# EasyEDA Pro project fei1554973967-sw3538-dff8db20.epro, board 底板_1
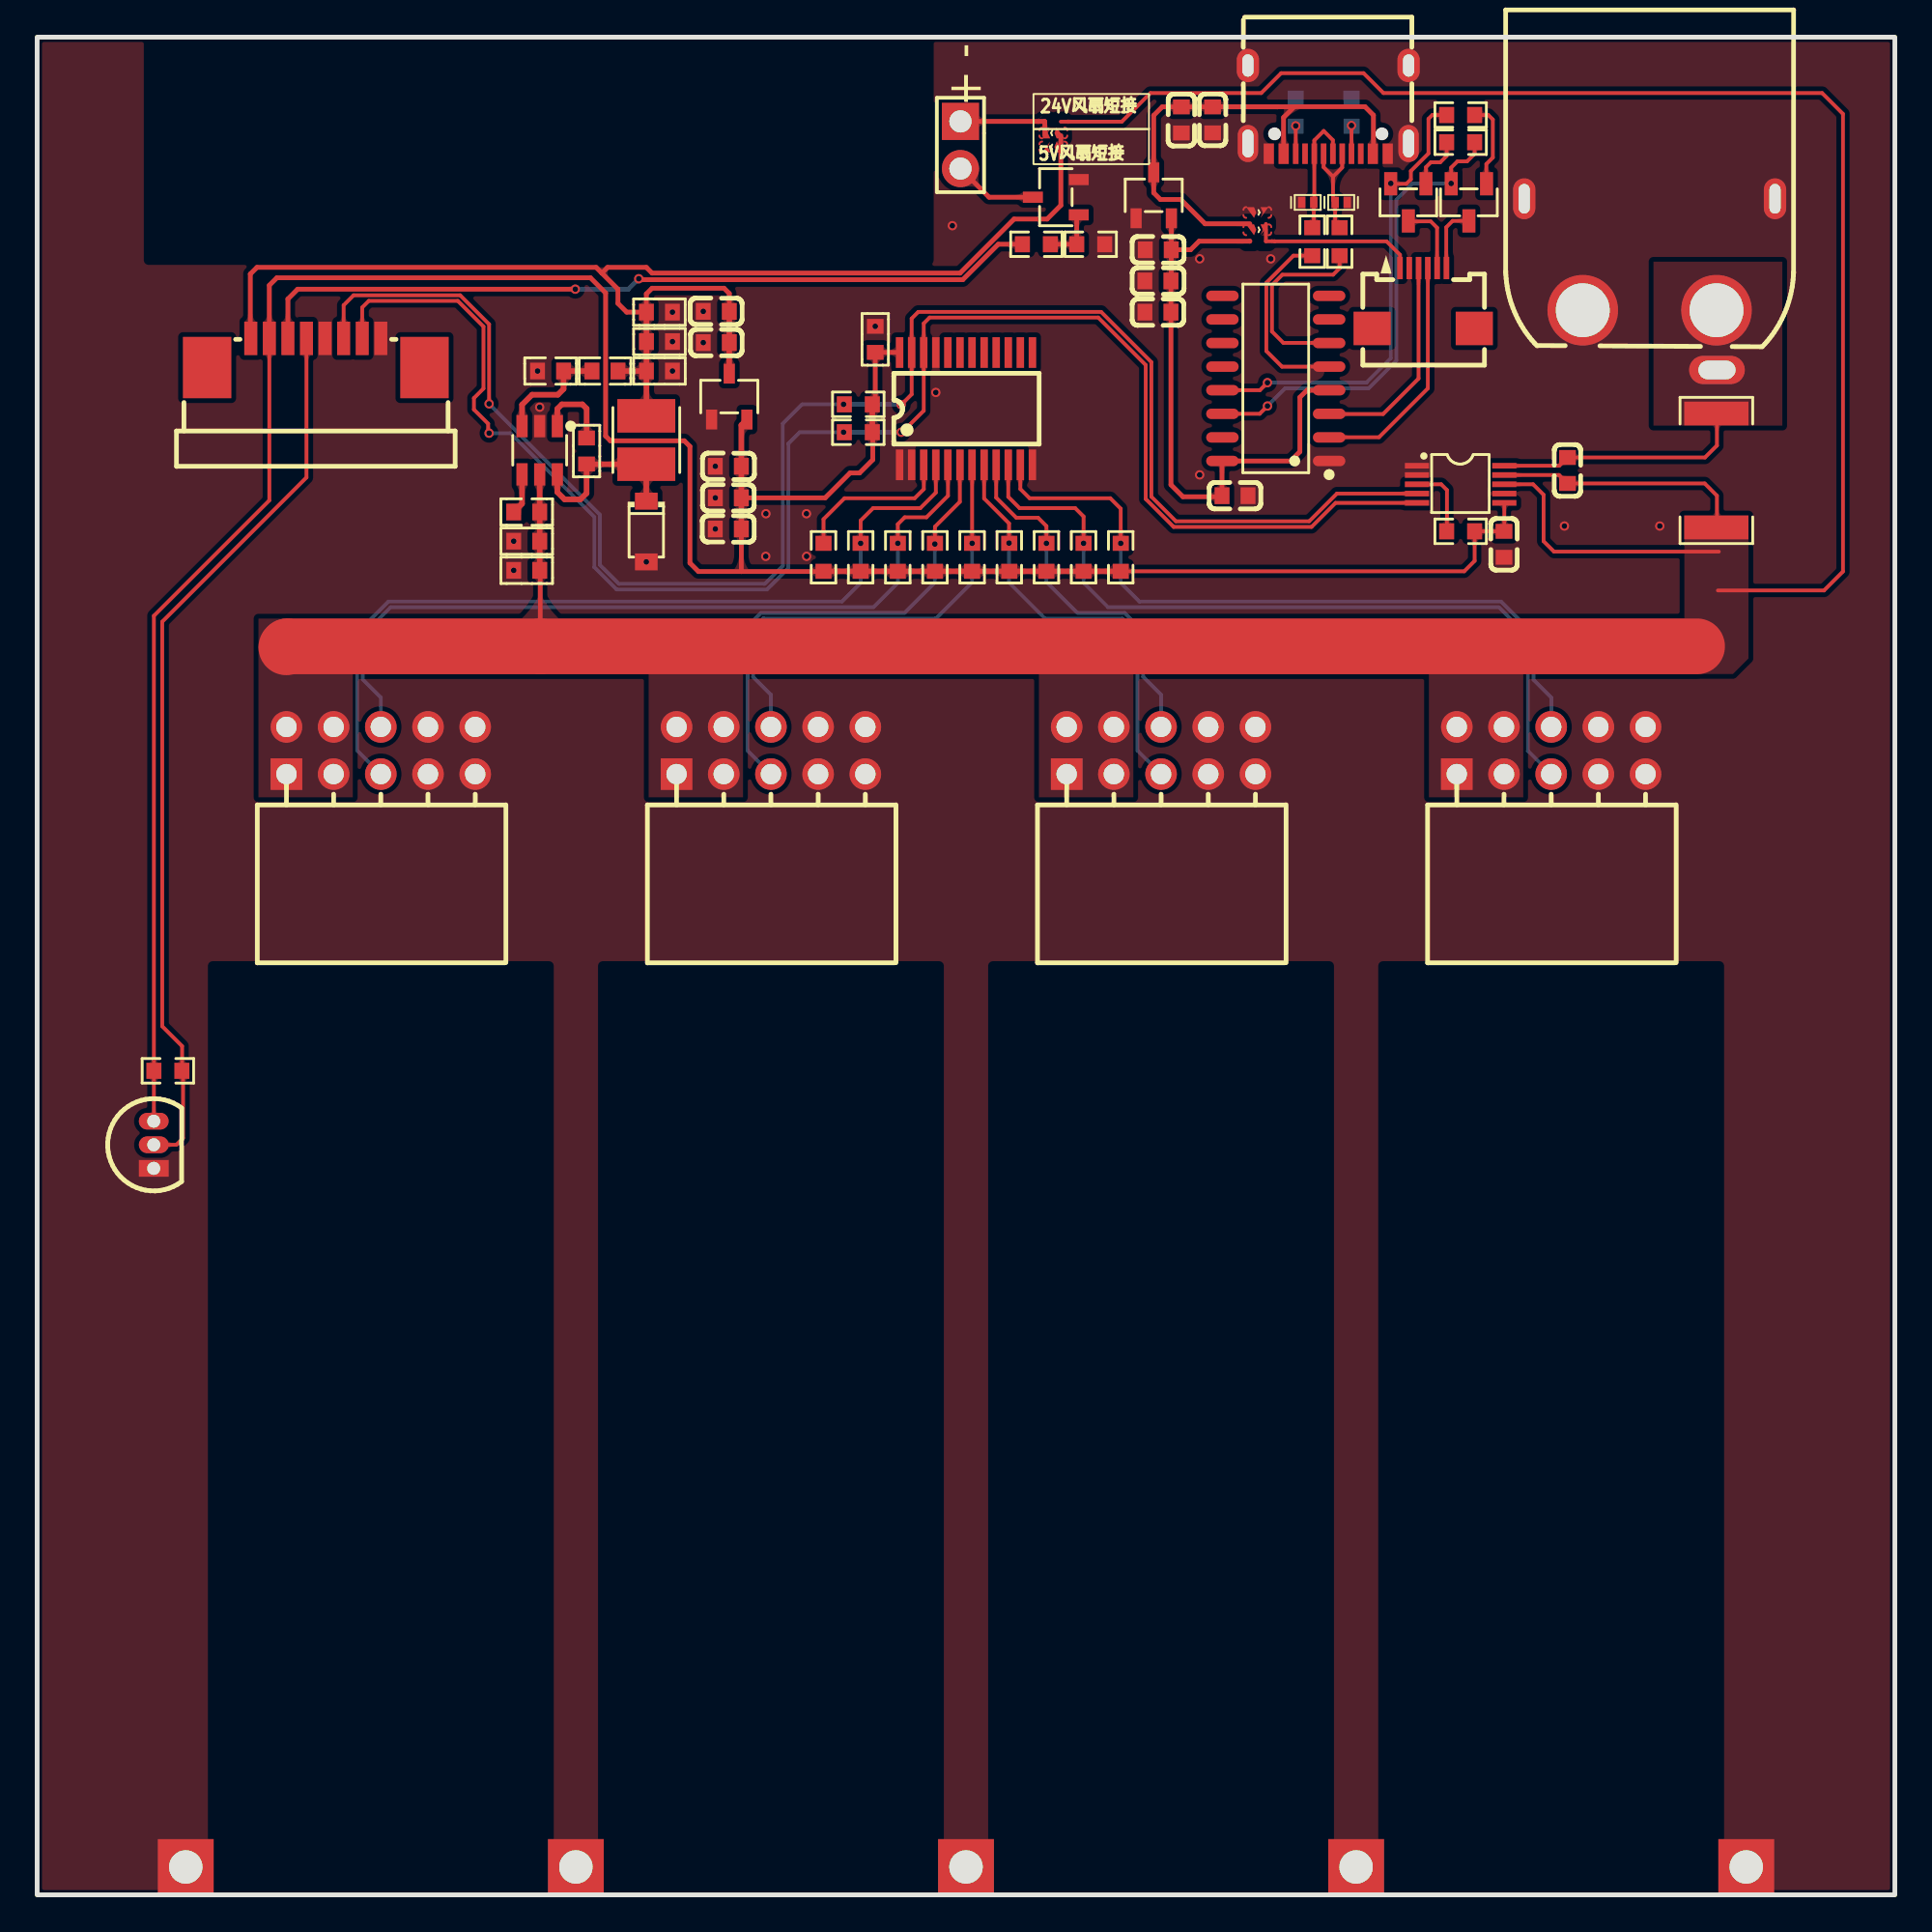
[diagram p11: board, top side]
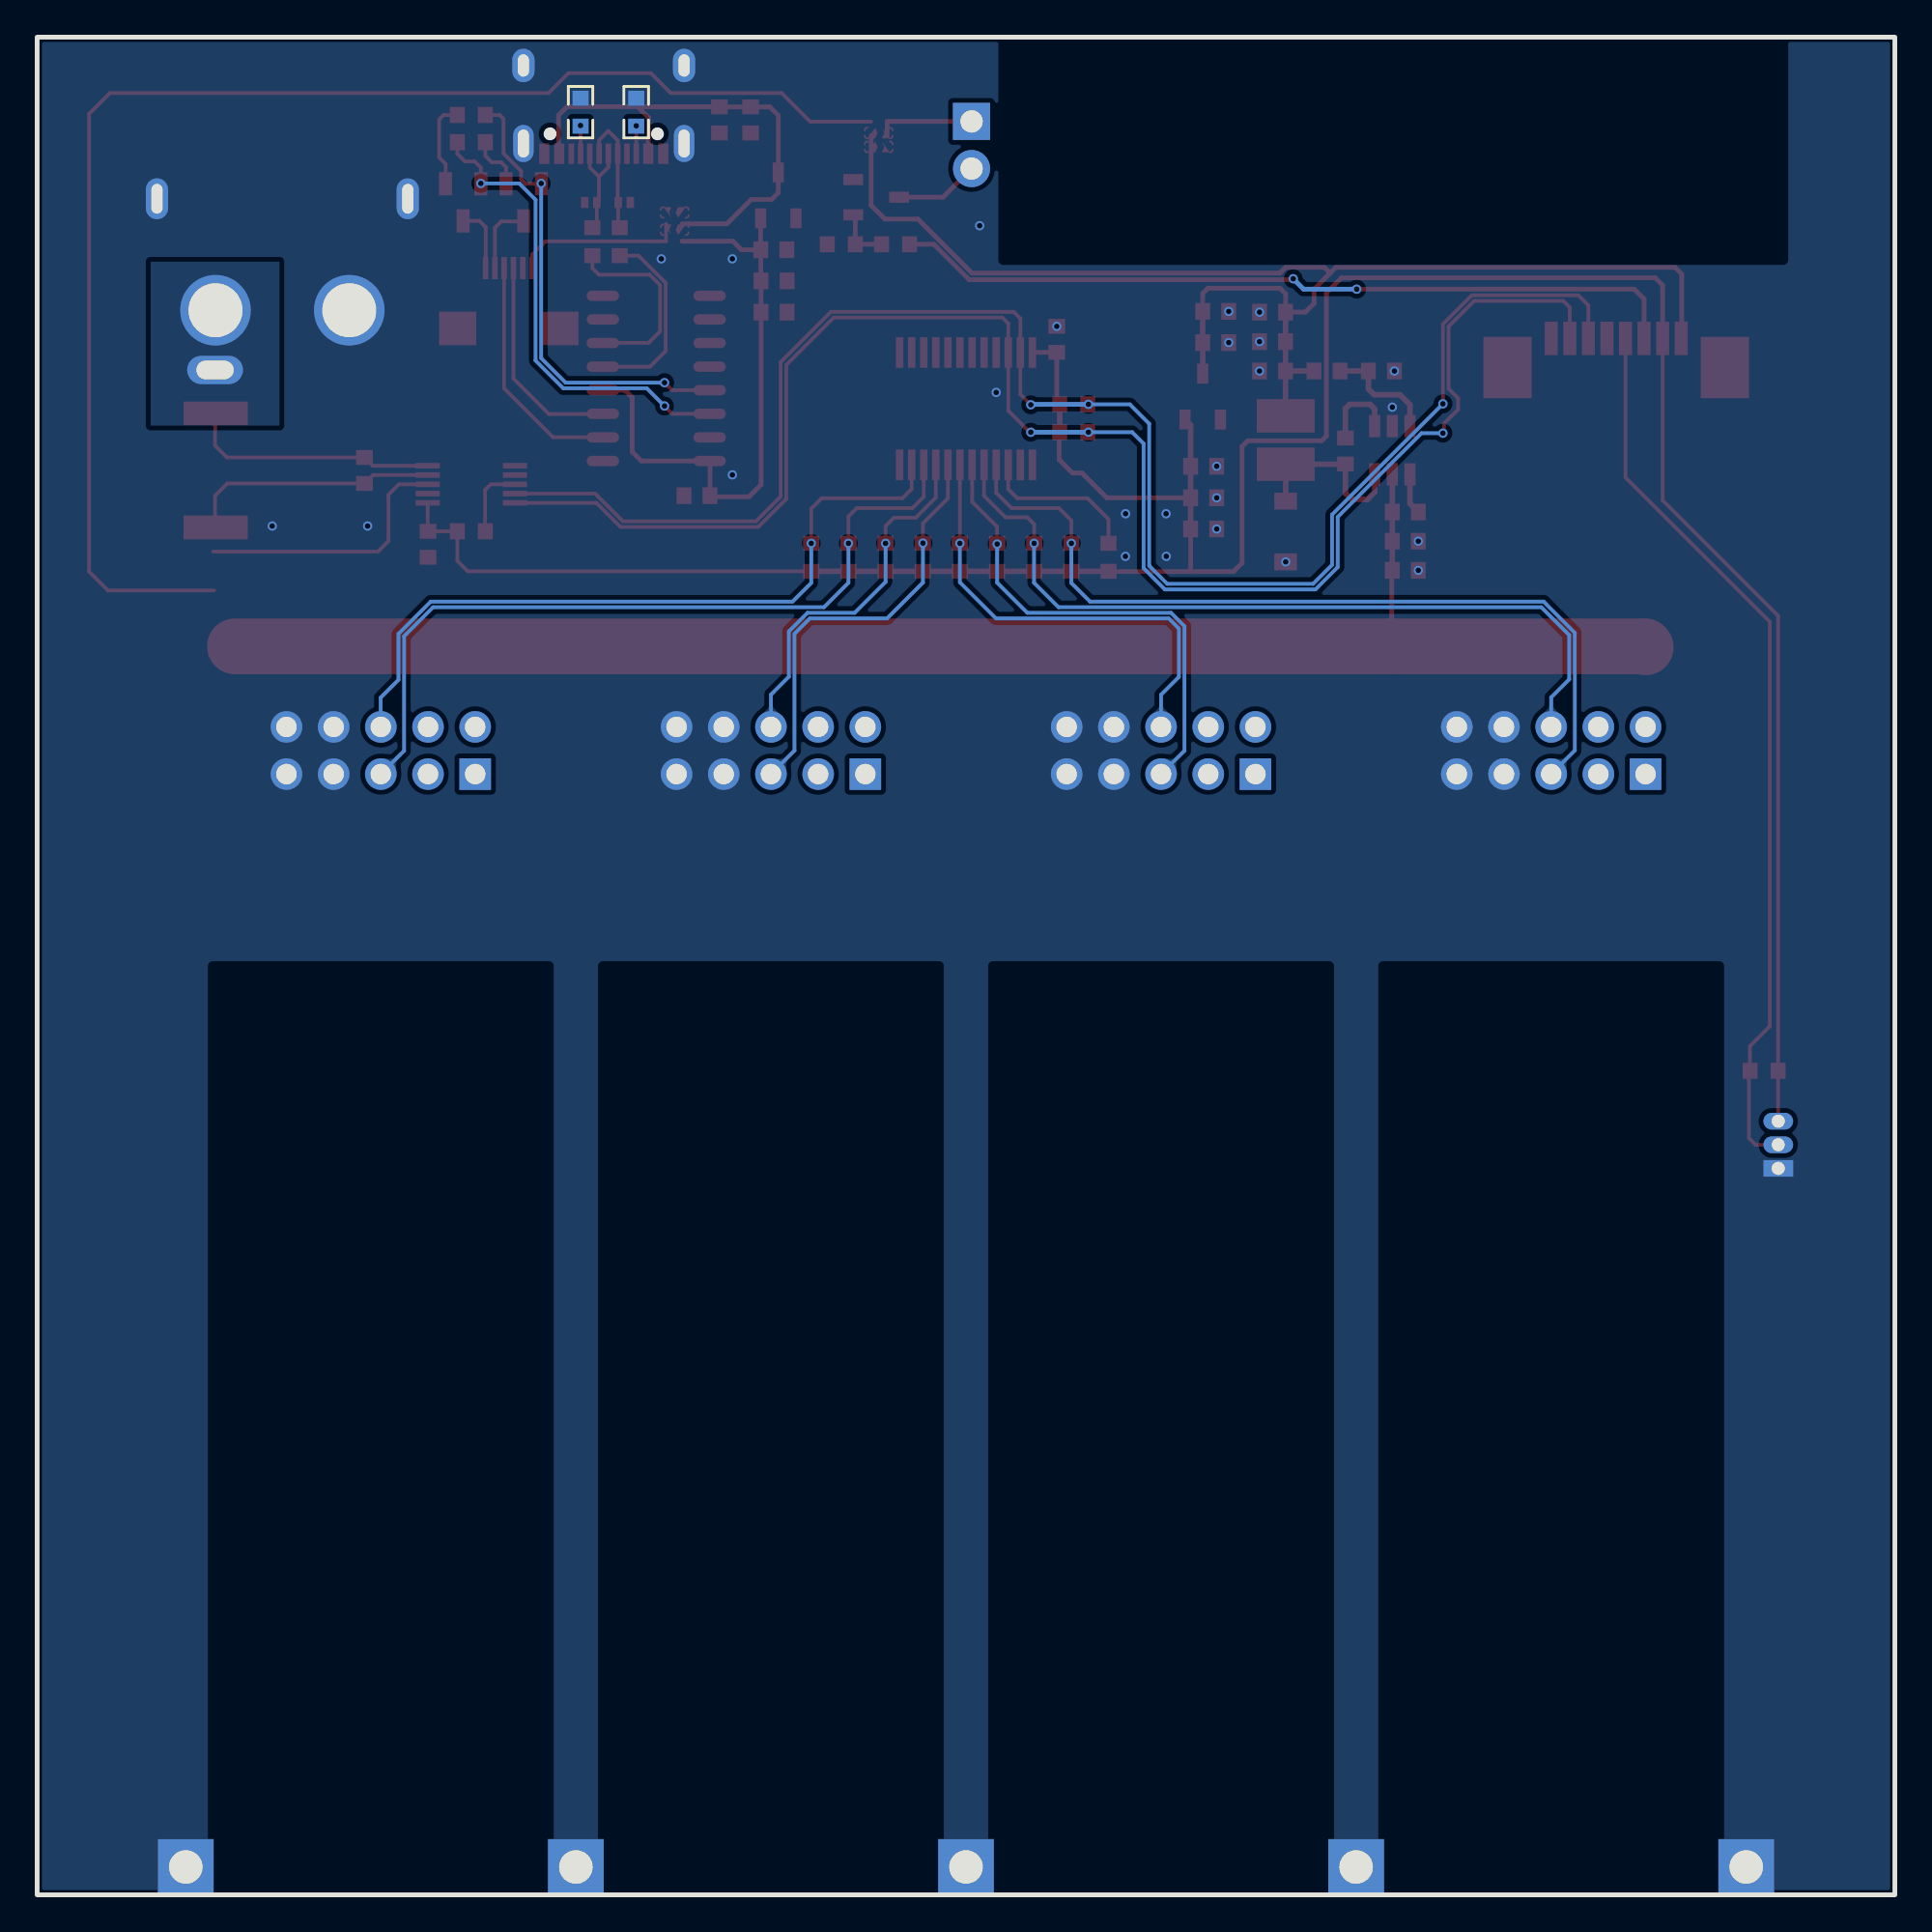
[diagram p12: board, bottom side, seen from below]

Outline 100 x 100 mm; copper layers: Top Layer, Bottom Layer. Coordinates in mm from the lower left corner of the outline.
Outline path: rectangle 0,100 100,0
Stack: Top Layer 0.035mm / Dielectric1 1.51mm FR4 er 4.5 / Bottom Layer 0.035mm

## Design rules (mm)
spacing copperThickness1oz (default): track to track 0.102, other pairs 0 to 0.175
spacing copperThickness2oz: track to track 0.203, other pairs 0.152 to 0.3
spacing Plane_innerPlane: track to track 0.102, other pairs 0 to 0.175
spacing Copper_copperRegion: track to track 0.102, other pairs 0 to 0.175
track width copperThickness1oz (default): min 0.127, default 0.254, max 5
track width copperThickness2oz: min 0.203, default 0.254, max 5
differential pair differentialPair (default): width min 0.127, default 0.254, max 2.54; gap min 0.152, default 0.152
pour e532 uses Copper_copperRegion
pour e534 uses Copper_copperRegion

## Placement (name value [footprint] x y rotation side)
+ -  PZ254V-11-02P  [HDR-TH_2P-P2.54-V-M]  49.7 94.2 270 top
C1  100nF  [C0603]  64.48 75.32 180 top
C2  0.1UF  [C0603]  78.96 72.7 90 top
C4  0.1UF  [C0603]  45.11 83.73 270 top
C13  0.1uf  [C0603]  82.38 76.67 90 top
C17  1uF  [C0603]  36.56 83.56 180 top
C18  1uF  [C0603]  37.21 75.2 180 top
C19  0.1UF  [C0603]  33.5 85.2 180 top
C32  22uF  [c0603]  36.56 85.24 0 top
C39  100nF  [c0603]  37.21 76.9 180 top
C69  0.1UF  [C0603]  33.5 83.61 180 top
C70  22UF  [C0603]  33.5 82.03 180 top
C72  220NF  [C0603]  29.58 77.72 90 top
C73  1UF  [C0603]  26.35 72.87 0 top
C85  1UF  [C0603]  26.35 71.3 0 top
C86  22uF  [c0603]  37.21 73.53 0 top
C87  22uF  [c0603]  60.35 88.55 0 top
C88  22uF  [c0603]  61.59 95.55 90 top
C89  1uF  [C0603]  63.27 95.55 270 top
C90  1uF  [C0603]  60.33 85.2 180 top
C91  100nF  [c0603]  60.33 86.88 180 top
CN1  XT60PW-M  [CONN-TH_XT60PW-M]  86.8 88.3 270 top
D1  1N5819HW-7-F  [SOD-123_L2.7-W1.6-LS3.7-RD]  32.79 73.39 270 top
D2  GESD0501BU-5BU  [DFN1006-BI]  68.4 91.1 180 top
D3  GESD0501BU-5BU  [DFN1006-BI]  70.2 91.1 180 top
FPC1  0.5-6PQFHY-H1.0 119  [FPC-SMD_6P-P0.50_SHOU-HAN_0.5-6PQFHY-H1.0]  74.61 85.95 0 top
FPC2  AFA07-S08FCA-00  [FPC-SMD_8P-P1.00_LCS-XJ]  15 83 180 top
H1  PM254-2-05-W-8.5  [HDR-TH_10P-P2.54-H-F-R2-C5-W8.5]  18.5 61.6 0 top
H2  PM254-2-05-W-8.5  [HDR-TH_10P-P2.54-H-F-R2-C5-W8.5]  39.5 61.6 0 top
H3  PM254-2-05-W-8.5  [HDR-TH_10P-P2.54-H-F-R2-C5-W8.5]  60.5 61.6 0 top
H4  PM254-2-05-W-8.5  [HDR-TH_10P-P2.54-H-F-R2-C5-W8.5]  81.5 61.6 0 top
L6  10uH  [IND-SMD_L3.5-W3.0]  32.79 78.31 270 top
NOREF  -  [Pad_e52]  8 1.5 0 top
NOREF#2  -  [Pad_e49]  92 1.5 0 top
NOREF#3  -  [Pad_e50]  29 1.5 0 top
NOREF#4  -  [Pad_e48]  71 1.5 0 top
NOREF#5  -  [Pad_e51]  50 1.5 0 top
NOREF#6  -  [Pad_e53]  90.42 82.08 0 top
Q2  HXY3400MI  [SOT-23-3_L2.9-W1.6-P1.90-LS2.8-BL-A]  54.84 91.38 90 top
Q4  SS8050  [SOT-23-3_L2.9-W1.3-P1.90-LS2.4-BR]  73.81 91.11 90 top
Q5  SS8050  [SOT-23-3_L2.9-W1.3-P1.90-LS2.4-BR]  77.07 91.11 90 top
R1  10kΩ  [R0603#2]  44.2 80.23 0 top
R2  10kΩ  [R0603#2]  44.2 78.73 0 top
R3  10kΩ  [R0603#2]  56.33 72 270 top
R4  10kΩ  [R0603#2]  54.33 72 270 top
R5  10kΩ  [R0603#2]  42.33 72 270 top
R6  10kΩ  [R0603#2]  44.33 72 270 top
R7  10kΩ  [R0603#2]  46.33 72 270 top
R8  10kΩ  [R0603#2]  48.33 72 270 top
R9  10kΩ  [R0603#2]  50.33 72 270 top
R10  10kΩ  [R0603#2]  52.33 72 270 top
R11  10kΩ  [R0603#2]  58.33 72 270 top
R19  3mΩ  [R2512]  90.39 76.67 270 top
R35  100K  [R0603]  26.35 74.46 180 top
R36  47K  [R0603]  30.57 82.05 180 top
R37  10K  [R0603]  27.64 82.05 180 top
R38  10kΩ  [R0603#2]  56.71 88.85 180 top
R39  100Ω  [R0603#2]  53.79 88.85 0 top
R40  4.7kΩ  [R0603#2]  7.04 44.36 0 top
R43  10K  [R0603#2]  76.63 73.4 180 top
R44  5.1kΩ  [R0603#2]  70.75 95.96 270 bottom
R45  5.1kΩ  [R0603#2]  67.75 95.96 270 bottom
R46  10kΩ  [R0603#2]  76.63 94.34 180 top
R47  10kΩ  [R0603#2]  76.63 95.81 0 top
R48  0Ω  [R0603#2]  68.64 88.99 270 top
R49  0Ω  [R0603#2]  70.11 88.99 270 top
SC29  -  [短接点0402]  65.66 89.02 180 top
SC30  -  [短接点0402]  65.66 89.95 180 top
SC31  -  [短接点0402]  54.72 95.45 0 top
SC32  -  [短接点0402]  54.72 94.7 0 top
U2  TCA9548APWR  [TSSOP-24_L7.8-W4.4-P0.65-LS6.4-BL]  50 80 0 top
U10  ME6211A33M3G-N  [SOT-23-3_L2.9-W1.6-P1.90-LS2.8-BR]  37.26 80.65 270 top
U12  INA226AIDGST  [VSSOP-10_L3.0-W3.0-P0.50-LS4.9-BL]  76.63 75.93 270 top
U17  ME3116AM6G  [SOT-23-6_L2.9-W1.6-P0.95-LS2.8-BL_3]  27.05 77.76 180 top
U18  DS18B20+  [TO-92-3_L4.9-W3.7-P1.27-L]  6.28 40.38 90 top
U19  CH340C  [SOP-16_L10.0-W3.9-P1.27-LS6.0-BL]  66.68 81.63 90 top
U20  ME6211A33M3G-N  [SOT-23-3_L2.9-W1.6-P1.90-LS2.8-BR]  60.1 91.48 270 top
USB1  TYPE-C 16PIN 2MD(073)  [USB-C-SMD_TYPE-C-6PIN-2MD-073]  69.5 96.1 180 top

## Footprints (pads in the part's own frame, mm; a bottom-side part is the same pattern mirrored in y, then rotated)
c0603
  rect 0.8x0.899 smd: 1(-0.701,0) 2(0.701,0)
C0603
  rect 0.8x0.9 smd: 1(-0.7,0) 2(0.7,0)
CONN-TH_XT60PW-M
  round 3.8 hole 2.9: 1(3,-3.6) 2(3,3.6)
  oval 2.2x1.2 hole 1.6x0.6: 3(-3,6.75) 4(-3,-6.75)
DFN1006-BI
  rect 0.4x0.6 smd: 1(-0.325,0) 2(0.325,0)
FPC-SMD_6P-P0.50_SHOU-HAN_0.5-6PQFHY-H1.0
  rect 0.3x1.2 smd: 1(-1.25,1.625) 2(-0.75,1.625) 3(-0.25,1.625) 4(0.25,1.625) 5(0.75,1.625) 6(1.25,1.625)
  rect 2x1.8 smd: 7(2.75,-1.625) 8(-2.75,-1.625)
FPC-SMD_8P-P1.00_LCS-XJ
  rect 0.7x1.8 smd: 1(-3.498,-0.785) 2(-2.498,-0.785) 3(-1.498,-0.785) 4(-0.498,-0.785) 5(0.502,-0.785) 6(1.502,-0.785) 7(2.502,-0.785) 8(3.5,-0.784)
  rect 2.6x3.3 smd: 9(-5.85,0.785) 10(5.85,0.785)
HDR-TH_2P-P2.54-V-M
  rect 2x2 hole 1.2: 1(-1.27,0)
  round 2 hole 1.2: 2(1.27,0)
HDR-TH_10P-P2.54-H-F-R2-C5-W8.5
  rect 1.7x1.7 hole 1.1: 1(-5.08,-1.27)
  round 1.7 hole 1.1: 2(-5.08,1.27) 3(-2.54,-1.27) 4(-2.54,1.27) 5(0,-1.27) 6(0,1.27) 7(2.54,-1.27) 8(2.54,1.27) 9(5.08,-1.27) 10(5.08,1.27)
IND-SMD_L3.5-W3.0
  rect 1.8x3.12 smd: 1(1.303,0) 2(-1.303,0)
Pad_e48
  rect 3x3 hole 1.8: 1(0,0)
Pad_e49
  rect 3x3 hole 1.8: 2(0,0)
Pad_e50
  rect 3x3 hole 1.8: 1(0,0)
Pad_e51
  rect 3x3 hole 1.8: 2(0,0)
Pad_e52
  rect 3x3 hole 1.8: 1(0,0)
Pad_e53
  oval 3x1.524 hole 2x1: 1(0,0)
R0603
  rect 0.8x0.9 smd: 1(-0.699,0.02) 2(0.702,0.02)
R0603#2
  rect 0.806x0.864 smd: 1(-0.753,0) 2(0.753,0)
R2512
  rect 1.282x3.456 smd: 1(-3.067,0) 2(3.067,0)
SOD-123_L2.7-W1.6-LS3.7-RD
  rect 0.91x1.22 smd: 1(-1.635,0) 2(1.635,0)
SOP-16_L10.0-W3.9-P1.27-LS6.0-BL
  oval 0.56x1.745 smd: 1(-4.445,-2.873) 2(-3.175,-2.873) 3(-1.905,-2.873) 4(-0.635,-2.873) 5(0.635,-2.873) 6(1.905,-2.873) 7(3.175,-2.873) 8(4.445,-2.873) 9(4.445,2.873) 10(3.175,2.873) 11(1.905,2.873) 12(0.635,2.873) 13(-0.635,2.873) 14(-1.905,2.873) 15(-3.175,2.873) 16(-4.445,2.873)
SOT-23-3_L2.9-W1.3-P1.90-LS2.4-BR
  rect 1.25x0.7 smd: 1(1,-0.95) 2(1,0.95) 3(-1,0)
SOT-23-3_L2.9-W1.6-P1.90-LS2.8-BL-A
  rect 0.6x1.07 smd: 1(-0.95,-1.235) 2(0,1.235) 3(0.95,-1.235)
SOT-23-3_L2.9-W1.6-P1.90-LS2.8-BR
  rect 1.07x0.6 smd: 1(1.235,-0.95) 2(1.235,0.95) 3(-1.235,0)
SOT-23-6_L2.9-W1.6-P0.95-LS2.8-BL_3
  rect 0.6x1.2 smd: 1(-0.95,-1.3) 2(0,-1.3) 3(0.95,-1.3) 4(0.95,1.3) 5(0,1.3) 6(-0.95,1.3)
TO-92-3_L4.9-W3.7-P1.27-L
  rect 0.9x1.6 hole 0.7: 1(-1.27,0)
  oval 0.9x1.6 hole 0.7: 2(0,0) 3(1.27,0)
TSSOP-24_L7.8-W4.4-P0.65-LS6.4-BL
  rect 0.4x1.65 smd: 1(-3.575,-3.022) 2(-2.925,-3.022) 3(-2.275,-3.022) 4(-1.625,-3.022) 5(-0.975,-3.022) 6(-0.325,-3.022) 7(0.325,-3.022) 8(0.975,-3.022) 9(1.625,-3.022) 10(2.275,-3.022) 11(2.925,-3.022) 12(3.575,-3.022) 13(3.575,3.022) 14(2.925,3.022) 15(2.275,3.022) 16(1.625,3.022) 17(0.975,3.022) 18(0.325,3.022) 19(-0.325,3.022) 20(-0.975,3.022) 21(-1.625,3.022) 22(-2.275,3.022) 23(-2.925,3.022) 24(-3.575,3.022)
USB-C-SMD_TYPE-C-6PIN-2MD-073
  rect 0.55x1.1 smd: 1(-3.2,2.375) 2(-2.4,2.375) 11(2.4,2.375) 12(3.2,2.375)
  rect 0.3x1.1 smd: 3(-1.75,2.375) 4(-1.25,2.375) 5(-0.75,2.375) 6(-0.25,2.375) 7(0.25,2.375) 8(0.75,2.375) 9(1.25,2.375) 10(1.75,2.375)
  oval 1.1x2 hole 0.6x1.5: 13(-4.325,1.825) 14(4.325,1.825)
  oval 1.2x1.8 hole 0.6x1.2: 13(-4.325,-2.375) 14(4.325,-2.375)
VSSOP-10_L3.0-W3.0-P0.50-LS4.9-BL
  rect 0.3x1.3 smd: 1(-1,-2.35) 2(-0.5,-2.35) 3(0,-2.35) 4(0.5,-2.35) 5(1,-2.35) 6(1,2.35) 7(0.5,2.35) 8(0,2.35) 9(-0.5,2.35) 10(-1,2.35)
短接点0402
  custom 0.579x0.58 smd: 1(-0.479,-0.61)
  custom 0.69x0.58 smd: 2(0.385,-0.61)

## Nets
As in the schematic, except:
24V: C13.2 CN1.2 NOREF#6.1 R19.1 U12.10
GND: C1.1 C2.1 C4.1 C17.2 C18.2 C19.1 C32.1 C39.2 C69.1 C70.1 C73.1 C85.1 C86.1 C87.1 C88.1 C89.2 C90.2 C91.2 CN1.1 CN1.3 CN1.4 D1.2 D2.2 D3.1 FPC1.2 FPC2.1 FPC2.4 H1.7 H1.8 H1.9 H1.10 H2.7 H2.8 H2.9 H2.10 H3.7 H3.8 H3.9 H3.10 H4.7 H4.8 H4.9 H4.10 NOREF.1 NOREF#2.2 NOREF#3.1 NOREF#4.1 NOREF#5.2 Q2.3 R37.2 R38.1 R44.1 R45.1 U2.1 U2.2 U2.12 U2.21 U10.1 U12.1 U12.2 U12.7 U17.2 U18.1 U19.1 U20.1 USB1.1 USB1.12 USB1.13 USB1.14
$1N3873: + -.2 Q2.2
$1N4090: + -.1 SC31.1 SC32.1

Pads without a net: FPC1 7 8; FPC2 9 10; U2 13 14 15 16 17 18 19 20; U19 7 8 9 10 11 12 15; USB1 3 9

## Via types
v1: diameter 0.5, hole 0.305, Top Layer to Bottom Layer, 47 vias

## Routing (per net, layer and track width the routed paths; a pad name or vN(x,y) marks a point on that pad's centre or on a via; arc(x,y) is an arc through that point)
3.3V: length 155.7
  Top Layer w0.2: U12.6 78.98,73.42 C2.2 R43.1 77.38,71.81 76.82,71.25 R11.2 ; 6.28,41.65 6.28,41.66 R40.1 6.28,68.85 12.5,75.06 FPC2.7
  Top Layer w0.254: C86.2 37.91,71.24 ; 37.91,71.24 35.6,71.24 35.14,71.69 35.14,77.97 34.83,78.27 30.86,78.27 30.6,78.53 30.6,86.23 29.78,87.05 12.9,87.05 12.5,86.64 FPC2.7 ; 37.91,71.24 42.32,71.24 R5.2 ; U2.24 46.41,83.03 C4.2 45.11,80.39 R1.2 ; R2.2 44.98,78.71 44.98,77.25 44.27,76.54 43.76,76.54 42.42,75.2 37.91,75.2
  Top Layer w0.3: C86.2 C39.1 37.91,79.12 U10.2 ; R11.2 R3.2 R4.2 R10.2 R9.2 R8.2 R7.2 R6.2 R5.2 ; R1.2 R2.2
3V3: length 32.7
  Top Layer w0.254: 65.28,89.02 65.27,89.02 62.55,89.02 62.09,88.55 C87.2 61.05,86.89 C91.1 C90.1 61.03,75.91 61.68,75.26 63.73,75.26 C1.2 63.78,77.18 63.78,77.19 67.47,77.19 67.97,77.68 67.97,80.61 68.35,81 69.52,81 ; 61.06,90.25 61.06,88.56
24V: length 13.6
  Top Layer w0.2: R19.1 90.42,79.71 90.42,78.02 89.78,77.38 C13.2 81.93,76.93 U12.10
+5V: length 73.7
  Top Layer w0.254: FPC2.8 11.47,83.81 11.47,87.25 11.83,87.61 30.09,87.61 30.4,87.3 ; C19.2 31.73,85.2 31.26,85.67 31.26,86.43 30.4,87.3 ; 30.4,87.3 30.7,87.61 32.79,87.61 33.1,87.3 49.68,87.3 52.59,90.21 54.37,90.21 55.11,90.95 55.11,94.7 ; C32.2 37.26,86.2 36.98,86.48 33.1,86.48 32.79,86.18 32.79,85.2
  Top Layer w0.3: R36.1 C70.2 32.8,79.62 L6.2 ; C32.2 37.26,83.56 37.26,83.56 U10.3 ; 32.8,85.2 C69.2 32.8,82.03
GND:
  vias: v1(25.65,72.87) v1(25.65,71.3) v1(26.94,82.03) v1(27.05,80.08) v1(32.79,71.75) v1(34.2,85.2) v1(34.2,83.61) v1(34.2,82.03) v1(35.86,85.24) v1(35.86,83.56) v1(36.51,76.9) v1(36.51,75.2) v1(36.51,73.53) v1(39.23,74.35) v1(39.22,72.05) v1(41.41,74.35) v1(41.42,72.05) v1(45.11,84.43) v1(48.38,80.88) v1(49.27,89.85) v1(62.58,88.07) v1(62.58,76.44) v1(66.4,88.07) v1(82.21,73.68) v1(87.35,73.68)
VBUS: length 30.6
  Top Layer w0.254: C89.1 66.76,96.25 66.78,96.26 ; C89.1 63.29,96.26 66.78,96.26 ; C89.1 C88.2 60.56,96.25 60.1,95.79 60.1,92.72 U20.3 60.1,91.62 60.47,91.26 61.56,91.26 62.87,89.95 65.28,89.95 ; 66.78,96.26 66.78,96.25 67.67,96.25 ; 67.67,96.25 67.09,95.68 67.09,93.73 USB1.11 ; 67.67,96.25 67.68,96.26 71.47,96.26 71.93,95.8 71.93,93.76 USB1.2
CC1: length 1.5
  Top Layer w0.2: USB1.4 v1(70.75,95.24)
CC2: length 1.5
  Top Layer w0.2: USB1.10 v1(67.75,95.23)
D+: length 6.9
  Top Layer w0.2: R48.1 68.72,89.83 D2.1 68.75,91.13 USB1.8 68.75,94.44 69.26,94.95 69.75,94.46 USB1.6
D-: length 5.8
  Top Layer w0.2: 69.76,92.49 69.25,93 USB1.7 ; 69.76,92.49 69.76,91.22 D3.2 69.87,89.98 R49.1 ; 69.76,92.49 70.25,92.98 USB1.5
DTR: length 25.1
  Top Layer w0.2: R47.1 75.1,95.81 74.9,95.6 74.9,93.74 73.95,92.79 73.95,92.35 73.7,92.1 72.87,92.1 72.86,92.11 ; v1(66.23,81.4) 65.82,81 63.78,81
  Bottom Layer w0.2: v1(66.23,81.4) 71.55,81.4 72.87,82.72 v1(72.87,92.13)
EN: length 3.6
  Top Layer w0.2: Q5.3 76.19,90.11 75.85,89.77 75.85,87.58 FPC1.6
FAN: length 42.9
  Top Layer w0.254: FPC2.6 13.5,85.91 14.03,86.43 v1(28.97,86.43) ; R39.1 51.74,88.85 49.83,86.94 32.44,86.94 v1(32.39,87)
  Bottom Layer w0.254: v1(32.39,87) 31.82,86.43 v1(28.97,86.43)
GPIO0: length 3.9
  Top Layer w0.2: Q4.3 73.84,90.08 75.02,90.08 75.36,89.74 75.36,87.57 FPC1.5
IN: length 189.2
  Top Layer w0.2: 55.11,95.45 58.39,95.45 59.93,96.99 65.89,96.99 66.96,98.06 71.4,98.06 72.47,96.99 96.09,96.99 97.21,95.87 97.21,71.24 96.19,70.22 90.47,70.22 ; R19.2 90.42,73.64 90.42,75.32 89.76,75.97 C13.1 81.92,76.43 U12.9 ; U12.8 80.53,75.93 81.09,75.37 81.09,72.87 81.65,72.31 90.53,72.31
  Top Layer w0.254: C85.2 27.08,71.27 27.08,67.21
  Top Layer w0.3: R35.1 27.05,71.3 ; 27.05,74.44 U17.5
  Top Layer w3: 89.35,67.21 13.46,67.21 13.41,67.16
RESET: length 8.7
  Top Layer w0.2: R5.1 42.33,74.05 43.46,75.18 47.24,75.18 47.73,75.67 47.73,76.97 U2.3
RTS: length 25.6
  Top Layer w0.2: R46.1 77.38,93.72 76.97,93.31 76.45,93.31 76.12,92.97 v1(76.12,92.12) ; v1(66.23,80.14) 65.81,79.72 U19.14
  Bottom Layer w0.2: v1(76.12,92.12) 74.04,92.12 73.17,91.25 73.17,82.59 71.68,81.1 67.18,81.1 v1(66.23,80.14)
RX: length 11.6
  Top Layer w0.2: 69.52,79.72 69.53,79.71 72.45,79.71 74.36,81.62 FPC1.3
SCL: length 92.4
  Top Layer w0.2: 24.28,78.68 24.28,79.19 23.51,79.96 23.51,80.57 24.03,81.08 24.03,84.42 22.64,85.8 17.85,85.8 17.5,85.45 FPC2.2 ; v1(46.51,78.73) 46.56,78.73 47.72,79.89 U2.22 47.72,84.59 48.04,84.91 57.12,84.91 59.68,82.35 59.68,75.14 61.18,73.64 68.6,73.64 69.89,74.93 74.28,74.93
  Bottom Layer w0.2: v1(43.41,78.73) 41.05,78.73 40.44,78.12 40.44,71.42 39.29,70.27 31.19,70.27 29.99,71.47 29.99,74.17 25.48,78.68 v1(24.33,78.68)
  Bottom Layer w0.254: v1(46.51,78.73) 46.51,78.73 v1(43.41,78.73)
SCL_1: length 43.5
  Top Layer w0.2: v1(46.33,72.75) 46.33,73.78 46.7,74.15 47.87,74.15 49.03,75.31 49.03,76.97 U2.5
  Bottom Layer w0.2: H1.6 18.5,64.46 17.53,65.43 17.53,67.81 19.03,69.31 45.02,69.31 46.34,70.63 46.34,72.75 v1(46.33,72.75)
SCL_2: length 24.8
  Top Layer w0.2: v1(50.33,72.75) 50.33,76.97 U2.7
  Bottom Layer w0.2: 50.33,72.75 50.33,70.65 48.39,68.71 39.09,68.71 38.54,68.17 38.54,65.56 39.5,64.6 H2.6
SCL_3: length 20
  Top Layer w0.2: U2.9 51.62,75.21 52.71,74.13 53.88,74.13 54.33,73.68 v1(54.33,72.75)
  Bottom Layer w0.2: v1(54.33,72.75) 54.33,70.67 55.99,69.01 58.53,69.01 59.53,68.01 59.53,65.57 60.5,64.61 H3.6
SCL_4: length 39.9
  Top Layer w0.2: U2.11 52.93,75.68 53.42,75.18 57.77,75.18 58.33,74.62 v1(58.33,72.75)
  Bottom Layer w0.2: H4.6 81.51,62.88 81.51,64.45 80.55,65.41 80.55,67.88 78.81,69.61 59.34,69.61 58.33,70.62 v1(58.33,72.75)
SDA: length 92.8
  Top Layer w0.2: FPC2.3 16.5,85.57 17.03,86.11 22.77,86.11 24.33,84.55 v1(24.33,80.26) ; 74.28,75.43 69.97,75.43 68.47,73.94 61.3,73.94 59.98,75.26 59.98,82.51 57.27,85.21 47.43,85.21 47.07,84.85 47.07,83.02 ; U2.23 47.07,80.77 v1(46.51,80.21)
  Bottom Layer w0.2: v1(24.33,80.26) 30.29,74.3 30.29,71.59 31.31,70.57 39.17,70.57 40.14,71.54 40.14,79.19 41.18,80.23 v1(43.41,80.23)
  Bottom Layer w0.254: v1(46.51,80.21) 46.49,80.23 v1(43.41,80.23)
SDA_1: length 45.9
  Top Layer w0.2: v1(44.33,72.75) 44.33,73.98 45,74.65 47.54,74.65 48.38,75.48 48.38,76.98 U2.4
  Bottom Layer w0.2: v1(44.33,72.75) 44.33,70.62 43.32,69.62 18.91,69.62 17.23,67.94 17.23,61.6 H1.5
SDA_2: length 26.4
  Top Layer w0.2: U2.6 49.67,76.97 49.67,74.99 48.33,73.65 R8.1
  Bottom Layer w0.2: H2.5 38.24,61.59 38.24,68.29 38.96,69.01 46.7,69.01 48.32,70.64 v1(48.32,72.72)
SDA_3: length 23
  Top Layer w0.2: R10.1 v1(52.32,72.77) 52.32,73.83 50.97,75.17 U2.8
  Bottom Layer w0.2: H3.5 59.23,61.6 59.23,67.88 58.41,68.71 54.25,68.71 52.32,70.64 v1(52.32,72.77)
SDA_4: length 42.8
  Top Layer w0.2: U2.10 52.28,75.26 52.88,74.65 55.88,74.65 56.33,74.2 v1(56.33,72.75)
  Bottom Layer w0.2: H4.5 80.25,61.58 80.25,67.75 78.69,69.31 57.65,69.31 56.33,70.63 v1(56.33,72.75)
TEMP: length 48.5
  Top Layer w0.2: FPC2.5 14.5,76.3 6.73,68.53 6.73,46.76 7.8,45.68 7.8,44.37 R40.2 7.85,44.3 7.85,40.74 7.49,40.38 U18.2
TX: length 12.9
  Top Layer w0.2: 69.52,78.45 69.53,78.46 72.23,78.46 74.86,81.09 FPC1.4
$1N2433: length 6.2
  Top Layer w0.3: U17.3 26.1,80.21 26.64,80.75 28.03,80.75 28.34,81.06 28.34,82.03 R36.2
$1N2434: length 9.6
  Top Layer w0.3: U17.6 28,75.51 28.39,75.12 29.24,75.12 29.58,75.45 C72.1 29.59,77.01 L6.1 D1.1
$1N2440: length 2.2
  Top Layer w0.3: R35.2 26.1,74.89 U17.4
$1N2441: length 4.3
  Top Layer w0.3: U17.1 28,79.99 28.24,80.23 29.35,80.23 29.58,80 29.58,78.42 C72.2
$1N3750: length 3
  Top Layer w0.254: Q2.1 55.96,90.32 R38.2 R39.2
$1N3873: length 4.5
  Top Layer w0.254: + -.2 51.24,91.38 Q2.2
$1N4090: length 5.3
  Top Layer w0.254: 54.24,94.7 54.24,95.45 54.23,95.47 + -.1
$1N6746: length 4
  Top Layer w0.2: R43.2 75.89,73.42 75.89,75.62 75.58,75.93 74.28,75.93
$1N6854: length 9.2
  Top Layer w0.2: FPC1.1 73.36,88.29 72.64,89.01 66.62,89.01 66.62,89.01 66.14,89.01 66.14,89.94
$1N7284: length 3
  Top Layer w0.2: Q4.1 74.76,93 75.02,93.26 75.53,93.26 75.87,93.61 R46.2
$1N7285: length 4.7
  Top Layer w0.2: R47.2 78.12,95.81 78.36,95.57 78.36,93.52 78.01,93.17 78.01,92.12 Q5.1
$1N7617: length 10.5
  Top Layer w0.2: 69.52,82.27 69.52,82.26 67.01,82.26 66.17,83.11 66.17,86.78 67.63,88.24 R48.2
$1N7618: length 10.5
  Top Layer w0.2: 69.52,83.53 69.51,83.54 67.08,83.54 66.47,84.16 66.47,86.65 67.03,87.21 69.76,87.21 70.11,87.56 R49.2

## Copper pours and planes (outline as drawn; the poured copper is in the pictures)
24V on Top Layer: 87.01,87.91 93.94,87.91 93.94,79.09 87.01,79.09
24V on Bottom Layer: 86.96,87.91 93.89,87.91 93.89,79.09 86.96,79.09
GND on Top Layer: -12.6,112.14 112.71,112.14 112.71,-27.91 -12.6,-27.91
GND on Bottom Layer: -20.2,125.7 110.72,125.7 110.72,-11.28 -20.2,-11.28
IN on Top Layer: 88.66,74.25 92.12,74.25 92.12,65.72 88.66,65.72
IN on Top Layer: 74.92,68.7 80,68.7 80,59.08 74.92,59.08
IN on Top Layer: 32.92,68.7 38,68.7 38,59.08 32.92,59.08
IN on Top Layer: 11.91,68.7 16.99,68.7 16.99,59.08 11.91,59.08
IN on Top Layer: 53.93,68.7 59.01,68.7 59.01,59.08 53.93,59.08

Small or netless copper shapes (teardrops, artwork), in the pictures only: 219 on Top Layer, 28 on Bottom Layer

## Text on the board
Top Silkscreen Layer: 5V风扇短接 | 24V风扇短接
